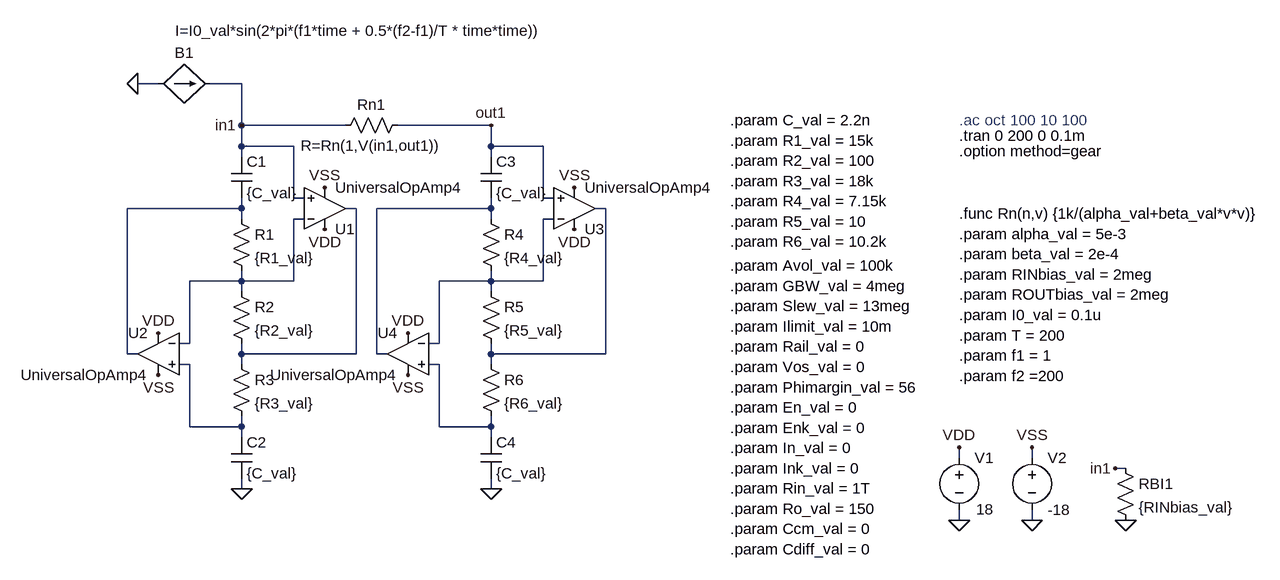
[diagram p0: schematic R2NN77UnitCellTest.asc]
R2NN77UnitCellTest.asc, the LTspice schematic file:
Version 4.1
SHEET 1 6228 5044
WIRE 800 -384 768 -384
WIRE 928 -384 880 -384
WIRE 928 -320 928 -384
WIRE 1088 -320 928 -320
WIRE 1312 -320 1168 -320
WIRE 928 -288 928 -320
WIRE 1008 -288 928 -288
WIRE 1312 -288 1312 -320
WIRE 1392 -288 1312 -288
WIRE 928 -272 928 -288
WIRE 1312 -272 1312 -288
WIRE 1008 -208 1008 -288
WIRE 1024 -208 1008 -208
WIRE 1392 -208 1392 -288
WIRE 1408 -208 1392 -208
WIRE 928 -192 928 -208
WIRE 928 -192 752 -192
WIRE 1104 -192 1088 -192
WIRE 1312 -192 1312 -208
WIRE 1312 -192 1136 -192
WIRE 1488 -192 1472 -192
WIRE 928 -176 928 -192
WIRE 1024 -176 1008 -176
WIRE 1312 -176 1312 -192
WIRE 1408 -176 1392 -176
WIRE 928 -80 928 -96
WIRE 928 -80 848 -80
WIRE 1008 -80 1008 -176
WIRE 1008 -80 928 -80
WIRE 1312 -80 1312 -96
WIRE 1312 -80 1232 -80
WIRE 1392 -80 1392 -176
WIRE 1392 -80 1312 -80
WIRE 928 -64 928 -80
WIRE 1312 -64 1312 -80
WIRE 848 16 848 -80
WIRE 848 16 832 16
WIRE 1232 16 1232 -80
WIRE 1232 16 1216 16
WIRE 752 32 752 -192
WIRE 768 32 752 32
WIRE 928 32 928 16
WIRE 1104 32 1104 -192
WIRE 1104 32 928 32
WIRE 1136 32 1136 -192
WIRE 1152 32 1136 32
WIRE 1312 32 1312 16
WIRE 1488 32 1488 -192
WIRE 1488 32 1312 32
WIRE 848 48 832 48
WIRE 928 48 928 32
WIRE 1232 48 1216 48
WIRE 1312 48 1312 32
WIRE 848 144 848 48
WIRE 928 144 928 128
WIRE 928 144 848 144
WIRE 1232 144 1232 48
WIRE 1312 144 1312 128
WIRE 1312 144 1232 144
WIRE 928 160 928 144
WIRE 1312 160 1312 144
WIRE 2032 192 2032 176
WIRE 2144 192 2144 176
WIRE 2288 208 2272 208
WIRE 928 240 928 224
WIRE 1312 240 1312 224
WIRE 2032 288 2032 272
WIRE 2144 288 2144 272
FLAG 2032 288 0
FLAG 2144 288 0
FLAG 2032 176 VDD
FLAG 2144 176 VSS
FLAG 768 -384 0
FLAG 928 240 0
FLAG 1312 240 0
FLAG 800 0 VDD
FLAG 1056 -160 VDD
FLAG 1440 -160 VDD
FLAG 1184 0 VDD
FLAG 800 64 VSS
FLAG 1056 -224 VSS
FLAG 1440 -224 VSS
FLAG 1184 64 VSS
FLAG 928 -320 in1
FLAG 1312 -320 out1
FLAG 2288 288 0
FLAG 2272 208 in1
SYMBOL voltage 2032 176 R0
WINDOW 123 0 0 Left 0
WINDOW 39 0 0 Left 0
WINDOW 3 26 95 Left 2
SYMATTR Value 18
SYMATTR InstName V1
SYMBOL voltage 2144 176 R0
WINDOW 123 0 0 Left 0
WINDOW 39 0 0 Left 0
SYMATTR InstName V2
SYMATTR Value -18
SYMBOL cap 912 -272 R0
SYMATTR InstName C1
SYMATTR Value {C_val}
SYMBOL res 912 -192 R0
SYMATTR InstName R1
SYMATTR Value {R1_val}
SYMBOL res 912 -80 R0
SYMATTR InstName R2
SYMATTR Value {R2_val}
SYMBOL res 912 32 R0
SYMATTR InstName R3
SYMATTR Value {R3_val}
SYMBOL cap 912 160 R0
SYMATTR InstName C2
SYMATTR Value {C_val}
SYMBOL cap 1296 -272 R0
SYMATTR InstName C3
SYMATTR Value {C_val}
SYMBOL res 1296 -192 R0
SYMATTR InstName R4
SYMATTR Value {R4_val}
SYMBOL res 1296 -80 R0
SYMATTR InstName R5
SYMATTR Value {R5_val}
SYMBOL res 1296 32 R0
SYMATTR InstName R6
SYMATTR Value {R6_val}
SYMBOL cap 1296 160 R0
SYMATTR InstName C4
SYMATTR Value {C_val}
SYMBOL res 1184 -336 R90
WINDOW 0 0 56 VBottom 2
WINDOW 3 32 56 VTop 2
SYMATTR InstName Rn1
SYMATTR Value R=Rn(1,V(in1,out1))
SYMBOL bi 800 -384 R270
WINDOW 0 32 40 VTop 2
WINDOW 3 97 308 VBottom 2
SYMATTR InstName B1
SYMATTR Value I=I0_val*sin(2*pi*(f1*time + 0.5*(f2-f1)/T * time*time))
SYMBOL OpAmps\\UniversalOpAmp4 1056 -192 M180
SYMATTR InstName U1
SYMATTR Value2 Avol={Avol_val} GBW={GBW_val} Slew={Slew_val}
SYMATTR SpiceLine Ilimit={Ilimit_val} Rail={Rail_val} Vos={Vos_val} Phimargin={Phimargin_val}
SYMATTR SpiceLine2 En={En_val} Enk={Enk_val} In={In_val} Ink={Ink_val} Rin={Rin_val} Ro={Ro_val} Ccm={Ccm_val} Cdiff={Cdiff_val}
SYMBOL res 2272 192 R0
SYMATTR InstName RBI1
SYMATTR Value {RINbias_val}
SYMBOL OpAmps\\UniversalOpAmp4 800 32 M0
SYMATTR InstName U2
SYMATTR Value2 Avol={Avol_val} GBW={GBW_val} Slew={Slew_val}
SYMATTR SpiceLine Ilimit={Ilimit_val} Rail={Rail_val} Vos={Vos_val} Phimargin={Phimargin_val}
SYMATTR SpiceLine2 En={En_val} Enk={Enk_val} In={In_val} Ink={Ink_val} Rin={Rin_val} Ro={Ro_val} Ccm={Ccm_val} Cdiff={Cdiff_val}
SYMBOL OpAmps\\UniversalOpAmp4 1440 -192 M180
SYMATTR InstName U3
SYMATTR Value2 Avol={Avol_val} GBW={GBW_val} Slew={Slew_val}
SYMATTR SpiceLine Ilimit={Ilimit_val} Rail={Rail_val} Vos={Vos_val} Phimargin={Phimargin_val}
SYMATTR SpiceLine2 En={En_val} Enk={Enk_val} In={In_val} Ink={Ink_val} Rin={Rin_val} Ro={Ro_val} Ccm={Ccm_val} Cdiff={Cdiff_val}
SYMBOL OpAmps\\UniversalOpAmp4 1184 32 M0
SYMATTR InstName U4
SYMATTR Value2 Avol={Avol_val} GBW={GBW_val} Slew={Slew_val}
SYMATTR SpiceLine Ilimit={Ilimit_val} Rail={Rail_val} Vos={Vos_val} Phimargin={Phimargin_val}
SYMATTR SpiceLine2 En={En_val} Enk={Enk_val} In={In_val} Ink={Ink_val} Rin={Rin_val} Ro={Ro_val} Ccm={Ccm_val} Cdiff={Cdiff_val}
TEXT 2032 -328 Left 2 ;.ac oct 100 10 100
TEXT 2032 -304 Left 2 !.tran 0 200 0 0.1m
TEXT 1680 -328 Left 2 !.param C_val = 2.2n\n.param R1_val = 15k\n.param R2_val = 100\n.param R3_val = 18k\n.param R4_val = 7.15k\n.param R5_val = 10\n.param R6_val = 10.2k
TEXT 2032 -184 Left 2 !.func Rn(n,v) {1k/(alpha_val+beta_val*v*v)}\n.param alpha_val = 5e-3\n.param beta_val = 2e-4\n.param RINbias_val = 2meg\n.param ROUTbias_val = 2meg\n.param I0_val = 0.1u\n.param T = 200\n.param f1 = 1\n.param f2 =200
TEXT 2032 -280 Left 2 !.option method=gear
TEXT 1680 -104 Left 2 !.param Avol_val = 100k\n.param GBW_val = 4meg\n.param Slew_val = 13meg\n.param Ilimit_val = 10m\n.param Rail_val = 0\n.param Vos_val = 0\n.param Phimargin_val = 56\n.param En_val = 0\n.param Enk_val = 0\n.param In_val = 0\n.param Ink_val = 0\n.param Rin_val = 1T\n.param Ro_val = 150\n.param Ccm_val = 0\n.param Cdiff_val = 0

The netlist it stands for:
* R2NN77UnitCellTest.asc
V1 VDD 0 18
V2 VSS 0 -18
C1 in1 N001 {C_val}
R1 N001 N005 {R1_val}
R2 N005 N002 {R2_val}
R3 N002 N007 {R3_val}
C2 N007 0 {C_val}
C3 out1 N003 {C_val}
R4 N003 N006 {R4_val}
R5 N006 N004 {R5_val}
R6 N004 N008 {R6_val}
C4 N008 0 {C_val}
Rn1 out1 in1 R=Rn(1,V(in1,out1))
B1 0 in1 I=I0_val*sin(2*pi*(f1*time + 0.5*(f2-f1)/T * time*time))
* U1: UniversalOpAmp4 Avol={Avol_val} GBW={GBW_val} Slew={Slew_val} Ilimit={Ilimit_val} Rail={Rail_val} Vos={Vos_val} Phimargin={Phimargin_val} En={En_val} Enk={Enk_val} In={In_val} Ink={Ink_val} Rin={Rin_val} Ro={Ro_val} Ccm={Ccm_val} Cdiff={Cdiff_val} (symbol OpAmps\UniversalOpAmp4 not available, pins judged from their places): In+=in1 In-=N005 V+=VDD V-=VSS OUT=N002
RBI1 in1 0 {RINbias_val}
* U2: UniversalOpAmp4 Avol={Avol_val} GBW={GBW_val} Slew={Slew_val} Ilimit={Ilimit_val} Rail={Rail_val} Vos={Vos_val} Phimargin={Phimargin_val} En={En_val} Enk={Enk_val} In={In_val} Ink={Ink_val} Rin={Rin_val} Ro={Ro_val} Ccm={Ccm_val} Cdiff={Cdiff_val} (symbol OpAmps\UniversalOpAmp4 not available, pins judged from their places): In+=N007 In-=N005 V+=VDD V-=VSS OUT=N001
* U3: UniversalOpAmp4 Avol={Avol_val} GBW={GBW_val} Slew={Slew_val} Ilimit={Ilimit_val} Rail={Rail_val} Vos={Vos_val} Phimargin={Phimargin_val} En={En_val} Enk={Enk_val} In={In_val} Ink={Ink_val} Rin={Rin_val} Ro={Ro_val} Ccm={Ccm_val} Cdiff={Cdiff_val} (symbol OpAmps\UniversalOpAmp4 not available, pins judged from their places): In+=out1 In-=N006 V+=VDD V-=VSS OUT=N004
* U4: UniversalOpAmp4 Avol={Avol_val} GBW={GBW_val} Slew={Slew_val} Ilimit={Ilimit_val} Rail={Rail_val} Vos={Vos_val} Phimargin={Phimargin_val} En={En_val} Enk={Enk_val} In={In_val} Ink={Ink_val} Rin={Rin_val} Ro={Ro_val} Ccm={Ccm_val} Cdiff={Cdiff_val} (symbol OpAmps\UniversalOpAmp4 not available, pins judged from their places): In+=N008 In-=N006 V+=VDD V-=VSS OUT=N003
* .ac oct 100 10 100
.tran 0 200 0 0.1m
.param C_val = 2.2n
.param R1_val = 15k
.param R2_val = 100
.param R3_val = 18k
.param R4_val = 7.15k
.param R5_val = 10
.param R6_val = 10.2k
.func Rn(n,v) {1k/(alpha_val+beta_val*v*v)}
.param alpha_val = 5e-3
.param beta_val = 2e-4
.param RINbias_val = 2meg
.param ROUTbias_val = 2meg
.param I0_val = 0.1u
.param T = 200
.param f1 = 1
.param f2 =200
.option method=gear
.param Avol_val = 100k
.param GBW_val = 4meg
.param Slew_val = 13meg
.param Ilimit_val = 10m
.param Rail_val = 0
.param Vos_val = 0
.param Phimargin_val = 56
.param En_val = 0
.param Enk_val = 0
.param In_val = 0
.param Ink_val = 0
.param Rin_val = 1T
.param Ro_val = 150
.param Ccm_val = 0
.param Cdiff_val = 0
.backanno
.end